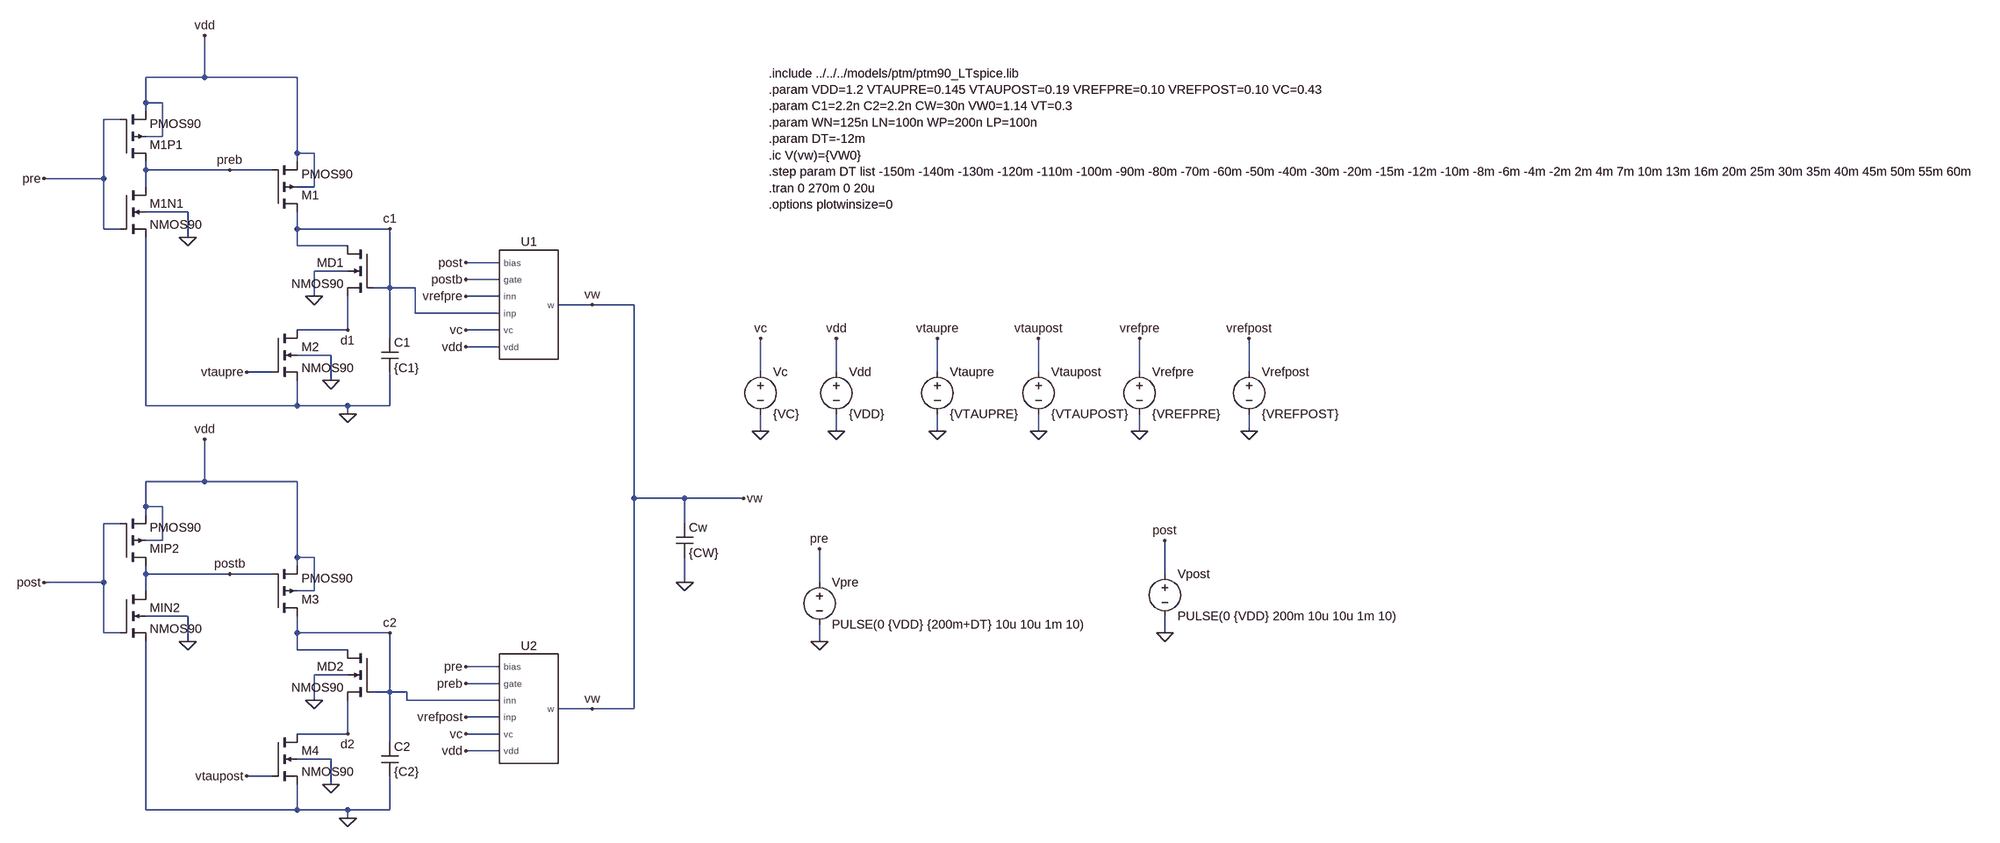
[diagram p0: schematic STDP_B90_fig14.asc]
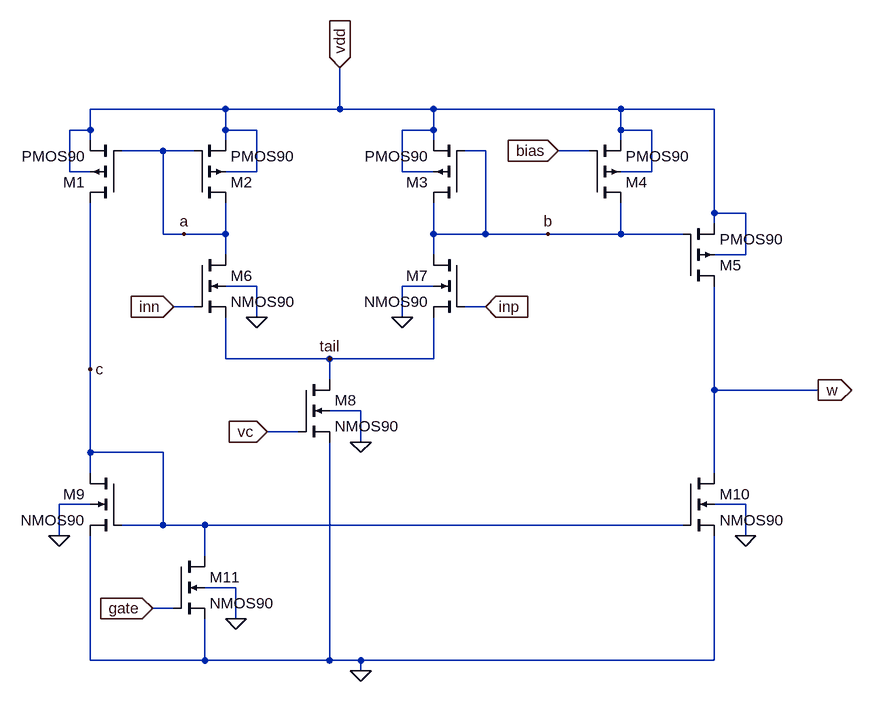
[diagram p1: sub-circuit ota.asc]
STDP_B90_fig14.asc, the LTspice schematic file:
Version 4
SHEET 1 3244 1396
WIRE -336 -32 -336 -112
WIRE -336 -32 -448 -32
WIRE -160 -32 -336 -32
WIRE -448 16 -448 -32
WIRE -416 16 -448 16
WIRE -448 32 -448 16
WIRE -496 48 -528 48
WIRE -416 80 -416 16
WIRE -416 80 -448 80
WIRE -160 112 -160 -32
WIRE -128 112 -160 112
WIRE -160 128 -160 112
WIRE -448 144 -448 128
WIRE -288 144 -448 144
WIRE -208 144 -288 144
WIRE -528 160 -528 48
WIRE -528 160 -656 160
WIRE -448 176 -448 144
WIRE -128 176 -128 112
WIRE -128 176 -160 176
WIRE -368 224 -448 224
WIRE -528 256 -528 160
WIRE -496 256 -528 256
WIRE -160 256 -160 224
WIRE 16 256 -160 256
WIRE -368 272 -368 224
WIRE -160 288 -160 256
WIRE -64 288 -160 288
WIRE 224 320 160 320
WIRE -64 336 -128 336
WIRE 224 352 160 352
WIRE 16 368 16 256
WIRE 16 368 -16 368
WIRE 64 368 16 368
WIRE -128 384 -128 336
WIRE 224 384 160 384
WIRE 400 400 336 400
WIRE 480 400 400 400
WIRE 64 416 64 368
WIRE 224 416 64 416
WIRE -64 448 -64 384
WIRE -64 448 -160 448
WIRE 224 448 160 448
WIRE 16 464 16 368
WIRE 224 480 160 480
WIRE -96 496 -160 496
WIRE -208 528 -256 528
WIRE 720 528 720 464
WIRE 864 528 864 464
WIRE 1056 528 1056 464
WIRE 1248 528 1248 464
WIRE 1440 528 1440 464
WIRE 1648 528 1648 464
WIRE -96 544 -96 496
WIRE -448 592 -448 272
WIRE -160 592 -160 544
WIRE -160 592 -448 592
WIRE -64 592 -160 592
WIRE 16 592 16 528
WIRE 16 592 -64 592
WIRE -64 608 -64 592
WIRE 720 640 720 608
WIRE 864 640 864 608
WIRE 1056 640 1056 608
WIRE 1248 640 1248 608
WIRE 1440 640 1440 608
WIRE 1648 640 1648 608
WIRE -336 736 -336 656
WIRE -336 736 -448 736
WIRE -160 736 -336 736
WIRE 480 768 480 400
WIRE 576 768 480 768
WIRE 688 768 576 768
WIRE -448 784 -448 736
WIRE -416 784 -448 784
WIRE -448 800 -448 784
WIRE -496 816 -528 816
WIRE 576 816 576 768
WIRE -416 848 -416 784
WIRE -416 848 -448 848
WIRE -160 880 -160 736
WIRE -128 880 -160 880
WIRE -160 896 -160 880
WIRE -448 912 -448 896
WIRE -288 912 -448 912
WIRE -208 912 -288 912
WIRE 1488 912 1488 848
WIRE -528 928 -528 816
WIRE -528 928 -656 928
WIRE 576 928 576 880
WIRE 832 928 832 864
WIRE -448 944 -448 912
WIRE -128 944 -128 880
WIRE -128 944 -160 944
WIRE -368 992 -448 992
WIRE -528 1024 -528 928
WIRE -496 1024 -528 1024
WIRE -160 1024 -160 992
WIRE 16 1024 -160 1024
WIRE 1488 1024 1488 992
WIRE -368 1040 -368 992
WIRE 832 1040 832 1008
WIRE -160 1056 -160 1024
WIRE -64 1056 -160 1056
WIRE 224 1088 160 1088
WIRE -64 1104 -128 1104
WIRE 224 1120 160 1120
WIRE 16 1136 16 1024
WIRE 16 1136 -16 1136
WIRE 48 1136 16 1136
WIRE -128 1152 -128 1104
WIRE 48 1152 48 1136
WIRE 224 1152 48 1152
WIRE 400 1168 336 1168
WIRE 480 1168 480 768
WIRE 480 1168 400 1168
WIRE 224 1184 160 1184
WIRE -64 1216 -64 1152
WIRE -64 1216 -160 1216
WIRE 224 1216 160 1216
WIRE 16 1232 16 1136
WIRE 224 1248 160 1248
WIRE -96 1264 -160 1264
WIRE -208 1296 -256 1296
WIRE -96 1312 -96 1264
WIRE -448 1360 -448 1040
WIRE -160 1360 -160 1312
WIRE -160 1360 -448 1360
WIRE -64 1360 -160 1360
WIRE 16 1360 16 1296
WIRE 16 1360 -64 1360
WIRE -64 1376 -64 1360
FLAG -368 272 0
FLAG -656 160 pre
FLAG -288 144 preb
FLAG -336 -112 vdd
FLAG -96 544 0
FLAG -128 384 0
FLAG 16 256 c1
FLAG -64 448 d1
FLAG -64 608 0
FLAG -256 528 vtaupre
FLAG 160 384 vrefpre
FLAG 160 320 post
FLAG 160 352 postb
FLAG 160 480 vdd
FLAG 160 448 vc
FLAG 400 400 vw
FLAG -368 1040 0
FLAG -656 928 post
FLAG -288 912 postb
FLAG -336 656 vdd
FLAG -96 1312 0
FLAG -128 1152 0
FLAG 16 1024 c2
FLAG -64 1216 d2
FLAG -64 1376 0
FLAG -256 1296 vtaupost
FLAG 160 1184 vrefpost
FLAG 160 1088 pre
FLAG 160 1120 preb
FLAG 160 1248 vdd
FLAG 160 1216 vc
FLAG 400 1168 vw
FLAG 576 928 0
FLAG 688 768 vw
FLAG 864 640 0
FLAG 864 464 vdd
FLAG 1056 640 0
FLAG 1056 464 vtaupre
FLAG 1248 640 0
FLAG 1248 464 vtaupost
FLAG 1440 640 0
FLAG 1440 464 vrefpre
FLAG 1648 640 0
FLAG 1648 464 vrefpost
FLAG 720 640 0
FLAG 720 464 vc
FLAG 832 1040 0
FLAG 832 864 pre
FLAG 1488 1024 0
FLAG 1488 848 post
SYMBOL pmos4 -496 128 M180
SYMATTR InstName M1P1
SYMATTR Value PMOS90
SYMATTR Value2 l={LP} w={WP}
SYMBOL nmos4 -496 176 R0
SYMATTR InstName M1N1
SYMATTR Value NMOS90
SYMATTR Value2 l={LN} w={WN}
SYMBOL pmos4 -208 224 M180
SYMATTR InstName M1
SYMATTR Value PMOS90
SYMATTR Value2 l={LP} w={WP}
SYMBOL nmos4 -208 448 R0
SYMATTR InstName M2
SYMATTR Value NMOS90
SYMATTR Value2 l={LN} w={WN}
SYMBOL nmos4 -16 288 M0
SYMATTR InstName MD1
SYMATTR Value NMOS90
SYMATTR Value2 l={LN} w={WN}
SYMBOL cap 0 464 R0
SYMATTR InstName C1
SYMATTR Value {C1}
SYMBOL cap 560 816 R0
SYMATTR InstName Cw
SYMATTR Value {CW}
SYMBOL OTA 272 400 R0
SYMATTR InstName U1
SYMBOL pmos4 -496 896 M180
SYMATTR InstName MIP2
SYMATTR Value PMOS90
SYMATTR Value2 l={LP} w={WP}
SYMBOL nmos4 -496 944 R0
SYMATTR InstName MIN2
SYMATTR Value NMOS90
SYMATTR Value2 l={LN} w={WN}
SYMBOL pmos4 -208 992 M180
SYMATTR InstName M3
SYMATTR Value PMOS90
SYMATTR Value2 l={LP} w={WP}
SYMBOL nmos4 -208 1216 R0
SYMATTR InstName M4
SYMATTR Value NMOS90
SYMATTR Value2 l={LN} w={WN}
SYMBOL nmos4 -16 1056 M0
SYMATTR InstName MD2
SYMATTR Value NMOS90
SYMATTR Value2 l={LN} w={WN}
SYMBOL cap 0 1232 R0
SYMATTR InstName C2
SYMATTR Value {C2}
SYMBOL OTA 272 1168 R0
SYMATTR InstName U2
SYMBOL voltage 864 512 R0
WINDOW 123 0 0 Left 0
WINDOW 39 0 0 Left 0
SYMATTR InstName Vdd
SYMATTR Value {VDD}
SYMBOL voltage 1056 512 R0
WINDOW 123 0 0 Left 0
WINDOW 39 0 0 Left 0
SYMATTR InstName Vtaupre
SYMATTR Value {VTAUPRE}
SYMBOL voltage 1248 512 R0
WINDOW 123 0 0 Left 0
WINDOW 39 0 0 Left 0
SYMATTR InstName Vtaupost
SYMATTR Value {VTAUPOST}
SYMBOL voltage 1440 512 R0
WINDOW 123 0 0 Left 0
WINDOW 39 0 0 Left 0
SYMATTR InstName Vrefpre
SYMATTR Value {VREFPRE}
SYMBOL voltage 1648 512 R0
WINDOW 123 0 0 Left 0
WINDOW 39 0 0 Left 0
SYMATTR InstName Vrefpost
SYMATTR Value {VREFPOST}
SYMBOL voltage 720 512 R0
WINDOW 123 0 0 Left 0
WINDOW 39 0 0 Left 0
SYMATTR InstName Vc
SYMATTR Value {VC}
SYMBOL voltage 832 912 R0
WINDOW 123 0 0 Left 0
WINDOW 39 0 0 Left 0
SYMATTR InstName Vpre
SYMATTR Value PULSE(0 {VDD} {200m+DT} 10u 10u 1m 10)
SYMBOL voltage 1488 896 R0
WINDOW 123 0 0 Left 0
WINDOW 39 0 0 Left 0
SYMATTR InstName Vpost
SYMATTR Value PULSE(0 {VDD} 200m 10u 10u 1m 10)
TEXT 736 -40 Left 2 !.include ../../../models/ptm/ptm90_LTspice.lib\n.param VDD=1.2 VTAUPRE=0.145 VTAUPOST=0.19 VREFPRE=0.10 VREFPOST=0.10 VC=0.43\n.param C1=2.2n C2=2.2n CW=30n VW0=1.14 VT=0.3\n.param WN=125n LN=100n WP=200n LP=100n\n.param DT=-12m\n.ic V(vw)={VW0}\n.step param DT list -150m -140m -130m -120m -110m -100m -90m -80m -70m -60m -50m -40m -30m -20m -15m -12m -10m -8m -6m -4m -2m 2m 4m 7m 10m 13m 16m 20m 25m 30m 35m 40m 45m 50m 55m 60m\n.tran 0 270m 0 20u\n.options plotwinsize=0

ota.asc, the sub-circuit schematic file:
Version 4
SHEET 1 1200 788
WIRE 208 -96 0 -96
WIRE 384 -96 384 -160
WIRE 384 -96 208 -96
WIRE 528 -96 384 -96
WIRE 816 -96 528 -96
WIRE 960 -96 816 -96
WIRE 0 -64 0 -96
WIRE 0 -64 -32 -64
WIRE 208 -64 208 -96
WIRE 256 -64 208 -64
WIRE 528 -64 528 -96
WIRE 528 -64 480 -64
WIRE 816 -64 816 -96
WIRE 864 -64 816 -64
WIRE 0 -48 0 -64
WIRE 208 -48 208 -64
WIRE 528 -48 528 -64
WIRE 816 -48 816 -64
WIRE 112 -32 48 -32
WIRE 160 -32 112 -32
WIRE 608 -32 576 -32
WIRE 768 -32 720 -32
WIRE -32 0 -32 -64
WIRE 0 0 -32 0
WIRE 256 0 256 -64
WIRE 256 0 208 0
WIRE 480 0 480 -64
WIRE 528 0 480 0
WIRE 864 0 864 -64
WIRE 864 0 816 0
WIRE 960 64 960 -96
WIRE 1008 64 960 64
WIRE 960 80 960 64
WIRE 112 96 112 -32
WIRE 144 96 112 96
WIRE 208 96 208 48
WIRE 208 96 144 96
WIRE 528 96 528 48
WIRE 608 96 608 -32
WIRE 608 96 528 96
WIRE 704 96 608 96
WIRE 816 96 816 48
WIRE 816 96 704 96
WIRE 912 96 816 96
WIRE 208 128 208 96
WIRE 528 128 528 96
WIRE 1008 128 1008 64
WIRE 1008 128 960 128
WIRE 256 176 208 176
WIRE 528 176 480 176
WIRE 160 208 128 208
WIRE 608 208 576 208
WIRE 256 224 256 176
WIRE 480 224 480 176
WIRE 208 288 208 224
WIRE 368 288 208 288
WIRE 528 288 528 224
WIRE 528 288 368 288
WIRE 0 304 0 48
WIRE 368 320 368 288
WIRE 960 336 960 176
WIRE 1120 336 960 336
WIRE 416 368 368 368
WIRE 320 400 272 400
WIRE 416 416 416 368
WIRE 0 432 0 304
WIRE 112 432 0 432
WIRE 0 464 0 432
WIRE 960 464 960 336
WIRE 0 512 -48 512
WIRE 1008 512 960 512
WIRE 112 544 112 432
WIRE 112 544 48 544
WIRE 176 544 112 544
WIRE 912 544 176 544
WIRE -48 560 -48 512
WIRE 1008 560 1008 512
WIRE 176 592 176 544
WIRE 224 640 176 640
WIRE 128 672 96 672
WIRE 224 688 224 640
WIRE 0 752 0 560
WIRE 176 752 176 688
WIRE 176 752 0 752
WIRE 368 752 368 416
WIRE 368 752 176 752
WIRE 416 752 368 752
WIRE 960 752 960 560
WIRE 960 752 416 752
WIRE 416 768 416 752
FLAG -48 560 0
FLAG 256 224 0
FLAG 480 224 0
FLAG 416 416 0
FLAG 1008 560 0
FLAG 224 688 0
FLAG 384 -160 vdd
IOPIN 384 -160 In
FLAG 144 96 a
FLAG 704 96 b
FLAG 368 288 tail
FLAG 416 768 0
FLAG 96 672 gate
IOPIN 96 672 In
FLAG 0 304 c
FLAG 128 208 inn
IOPIN 128 208 In
FLAG 272 400 vc
IOPIN 272 400 In
FLAG 608 208 inp
IOPIN 608 208 In
FLAG 720 -32 bias
IOPIN 720 -32 In
FLAG 1120 336 w
IOPIN 1120 336 Out
SYMBOL nmos4 48 464 M0
SYMATTR InstName M9
SYMATTR Value NMOS90
SYMATTR Value2 l={LN} w={WN}
SYMBOL pmos4 160 48 M180
SYMATTR InstName M2
SYMATTR Value PMOS90
SYMATTR Value2 l={LP} w={WP}
SYMBOL pmos4 48 48 R180
SYMATTR InstName M1
SYMATTR Value PMOS90
SYMATTR Value2 l={LP} w={WP}
SYMBOL nmos4 160 128 R0
SYMATTR InstName M6
SYMATTR Value NMOS90
SYMATTR Value2 l={LN} w={WN}
SYMBOL pmos4 576 48 R180
SYMATTR InstName M3
SYMATTR Value PMOS90
SYMATTR Value2 l={LP} w={WP}
SYMBOL pmos4 768 48 M180
SYMATTR InstName M4
SYMATTR Value PMOS90
SYMATTR Value2 l={LP} w={WP}
SYMBOL pmos4 912 176 M180
SYMATTR InstName M5
SYMATTR Value PMOS90
SYMATTR Value2 l={LP} w={WP}
SYMBOL nmos4 576 128 M0
SYMATTR InstName M7
SYMATTR Value NMOS90
SYMATTR Value2 l={LN} w={WN}
SYMBOL nmos4 320 320 R0
SYMATTR InstName M8
SYMATTR Value NMOS90
SYMATTR Value2 l={LN} w={WN}
SYMBOL nmos4 912 464 R0
SYMATTR InstName M10
SYMATTR Value NMOS90
SYMATTR Value2 l={LN} w={WN}
SYMBOL nmos4 128 592 R0
SYMATTR InstName M11
SYMATTR Value NMOS90
SYMATTR Value2 l={LN} w={WN}

The netlist it stands for:
* STDP_B90_fig14.asc
M1P1 preb pre vdd vdd PMOS90 l={LP} w={WP}
M1N1 preb pre 0 0 NMOS90 l={LN} w={WN}
M1 c1 preb vdd vdd PMOS90 l={LP} w={WP}
M2 d1 vtaupre 0 0 NMOS90 l={LN} w={WN}
MD1 c1 c1 d1 0 NMOS90 l={LN} w={WN}
C1 c1 0 {C1}
Cw vw 0 {CW}
XU1 post postb vrefpre c1 vc vdd vw ota
MIP2 postb post vdd vdd PMOS90 l={LP} w={WP}
MIN2 postb post 0 0 NMOS90 l={LN} w={WN}
M3 c2 postb vdd vdd PMOS90 l={LP} w={WP}
M4 d2 vtaupost 0 0 NMOS90 l={LN} w={WN}
MD2 c2 c2 d2 0 NMOS90 l={LN} w={WN}
C2 c2 0 {C2}
XU2 pre preb c2 vrefpost vc vdd vw ota
Vdd vdd 0 {VDD}
Vtaupre vtaupre 0 {VTAUPRE}
Vtaupost vtaupost 0 {VTAUPOST}
Vrefpre vrefpre 0 {VREFPRE}
Vrefpost vrefpost 0 {VREFPOST}
Vc vc 0 {VC}
Vpre pre 0 PULSE(0 {VDD} {200m+DT} 10u 10u 1m 10)
Vpost post 0 PULSE(0 {VDD} 200m 10u 10u 1m 10)

* block symbol definitions
.subckt ota bias gate inn inp vc vdd w
M9 c c 0 0 NMOS90 l={LN} w={WN}
M2 a a vdd vdd PMOS90 l={LP} w={WP}
M1 c a vdd vdd PMOS90 l={LP} w={WP}
M6 a inn tail 0 NMOS90 l={LN} w={WN}
M3 b b vdd vdd PMOS90 l={LP} w={WP}
M4 b bias vdd vdd PMOS90 l={LP} w={WP}
M5 w b vdd vdd PMOS90 l={LP} w={WP}
M7 b inp tail 0 NMOS90 l={LN} w={WN}
M8 tail vc 0 0 NMOS90 l={LN} w={WN}
M10 w c 0 0 NMOS90 l={LN} w={WN}
M11 c gate 0 0 NMOS90 l={LN} w={WN}
.ends ota

.model NMOS NMOS
.model PMOS PMOS
.lib standard.mos
.include ../../../models/ptm/ptm90_LTspice.lib
.param VDD=1.2 VTAUPRE=0.145 VTAUPOST=0.19 VREFPRE=0.10 VREFPOST=0.10 VC=0.43
.param C1=2.2n C2=2.2n CW=30n VW0=1.14 VT=0.3
.param WN=125n LN=100n WP=200n LP=100n
.param DT=-12m
.ic V(vw)={VW0}
.step param DT list -150m -140m -130m -120m -110m -100m -90m -80m -70m -60m -50m -40m -30m -20m -15m -12m -10m -8m -6m -4m -2m 2m 4m 7m 10m 13m 16m 20m 25m 30m 35m 40m 45m 50m 55m 60m
.tran 0 270m 0 20u
.options plotwinsize=0
.backanno
.end